# Altium project AC Voltage Controller.PrjPcb
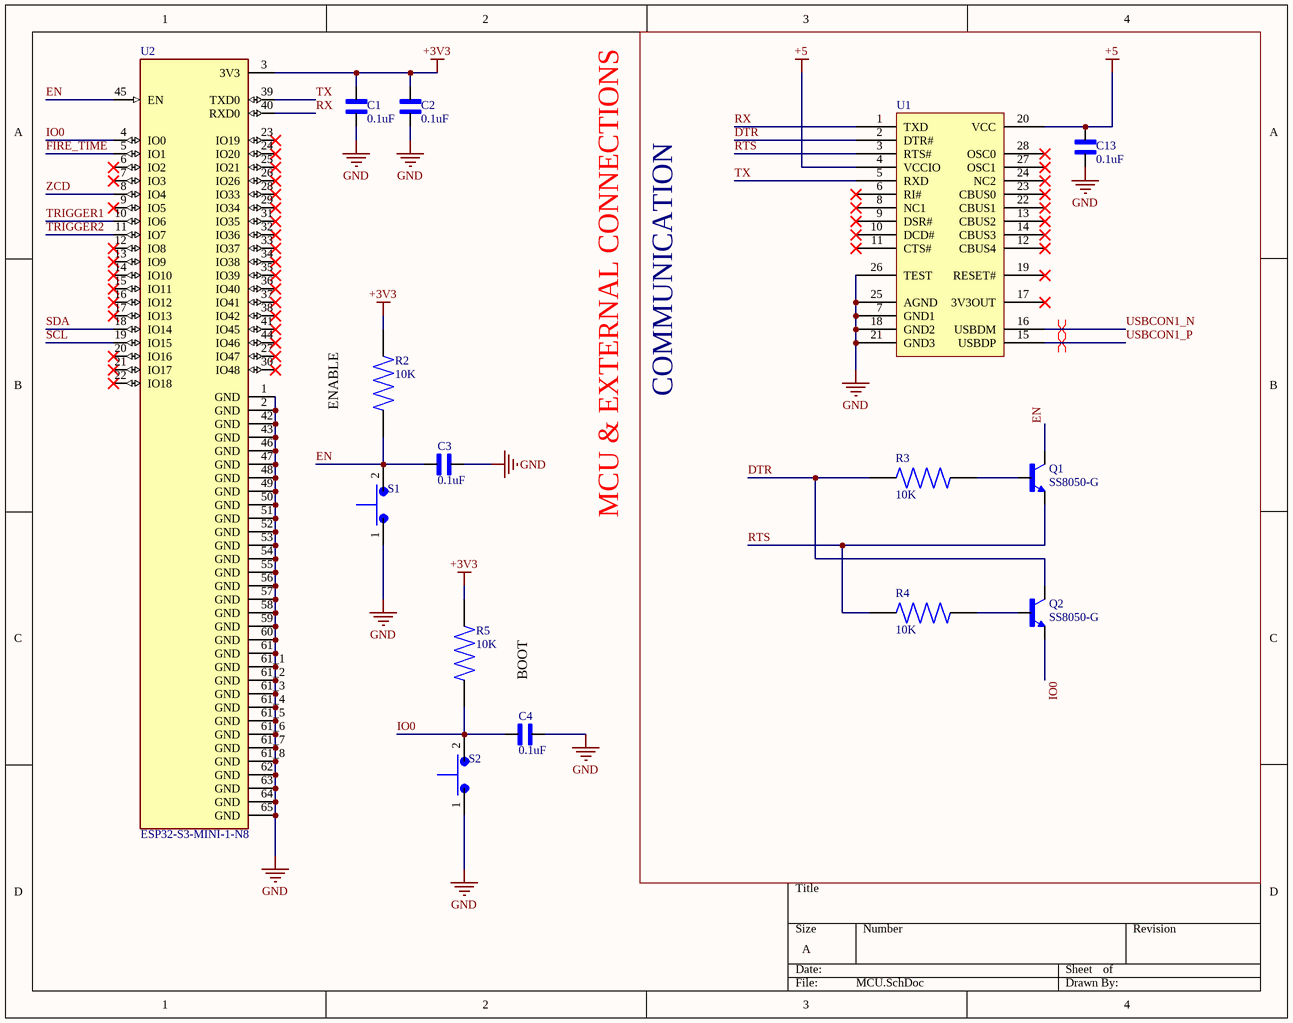
[diagram p0: MCU.SchDoc]
3 sheets, 50 parts. Net scope: global (net labels, ports and power ports of the same name join across sheets).
Board file: AC Voltage Controller.PcbDoc
Sheets:
  MCU.SchDoc
  USB & Power.SchDoc
  Triac Drive.SchDoc

## Sheet MCU.SchDoc
size A; SheetNumber: 1; SheetTotal: 3

### Parts
C1  0.1uF  [CAPC1005X61N]
C2  0.1uF  [CAPC1005X61N]
C3  0.1uF  [CAPC1005X61N]
C4  0.1uF  [CAPC1005X61N]
C13  0.1uF  [CAPC1005X61N]
Q1  SS8050-G  [TRANS_SS8050-G]
Q2  SS8050-G  [TRANS_SS8050-G]
R2  10K  [RESC1005X35N]
R3  10K  [RESC1005X35N]
R4  10K  [RESC1005X35N]
R5  10K  [RESC1005X35N]
S1  TS10-63-26-BE-250-SMT-TR  [SW_TS10-63-26-BE-250-SMT-TR]  (value not drawn)
S2  TS10-63-26-BE-250-SMT-TR  [SW_TS10-63-26-BE-250-SMT-TR]  (value not drawn)
U1  FT232RL, Universal Asynchronous Receiver & Transmitter 3MBd, 28-Pin, SSOP  [SOP65P780X200-28N]  (value not drawn)
U2  ESP32-S3-MINI-1-N8  [XCVR_ESP32-S3-MINI-1-N8]

### Blocks framed on the sheet
COMMUNICATION: C13 Q1 Q2 R3 R4 U1

### Nets
+3V3: C1.2 C2.2 R2.2 R5.2 U2.3(3V3)
+5: C13.2 U1.4(VCCIO) U1.20(VCC)
GND: C1.1 C2.1 C3.2 C4.2 C13.1 S1.1 S2.1 U1.7(GND1) U1.18(GND2) U1.21(GND3) U1.25(AGND) U1.26(TEST) U2.1(GND) U2.2(GND) U2.42(GND) U2.43(GND) U2.46(GND) U2.47(GND) U2.48(GND) U2.49(GND) U2.50(GND) U2.51(GND) U2.52(GND) U2.53(GND) U2.54(GND) U2.55(GND) U2.56(GND) U2.57(GND) U2.58(GND) U2.59(GND) U2.60(GND) U2.61(GND) U2.61_1(GND) U2.61_2(GND) U2.61_3(GND) U2.61_4(GND) U2.61_5(GND) U2.61_6(GND) U2.61_7(GND) U2.61_8(GND) U2.62(GND) U2.63(GND) U2.64(GND) U2.65(GND)
DTR: Q2.3(C) R3.1 U1.2(DTR#)
EN: C3.1 Q1.3(C) R2.1 S1.2 U2.45(EN)
FIRE_TIME: U2.5(IO1)
IO0: C4.1 Q2.2(E) R5.1 S2.2 U2.4(IO0)
RTS: Q1.2(E) R4.1 U1.3(RTS#)
RX: U1.1(TXD) U2.40(RXD0)
SCL: U2.19(IO15)
SDA: U2.18(IO14)
TRIGGER1: U2.10(IO6)
TRIGGER2: U2.11(IO7)
TX: U1.5(RXD) U2.39(TXD0)
USBCON1_N: U1.16(USBDM)
USBCON1_P: U1.15(USBDP)
ZCD: U2.8(IO4)
NetQ1_1: Q1.1(B) R3.2
NetQ2_1: Q2.1(B) R4.2

Not connected (* = marked no-connect by the designer): U1 6(RI#)* 8(NC1)* 9(DSR#)* 10(DCD#)* 11(CTS#)* 12(CBUS4)* 13(CBUS2)* 14(CBUS3)* 17(3V3OUT)* 19(RESET#)* 22(CBUS1)* 23(CBUS0)* 24(NC2)* 27(OSC1)* 28(OSC0)*; U2 6(IO2)* 7(IO3)* 9(IO5)* 12(IO8)* 13(IO9)* 14(IO10)* 15(IO11)* 16(IO12)* 17(IO13)* 20(IO16)* 21(IO17)* 22(IO18)* 23(IO19)* 24(IO20)* 25(IO21)* 26(IO26)* 27(IO47)* 28(IO33)* 29(IO34)* 30(IO48)* 31(IO35)* 32(IO36)* 33(IO37)* 34(IO38)* 35(IO39)* 36(IO40)* 37(IO41)* 38(IO42)* 41(IO45)* 44(IO46)*

### Layout directives
differential pair: USBCON1_N, USBCON1_P

### Notes on the sheet
- (near R2) ENABLE
- MCU & EXTERNAL CONNECTIONS
- BOOT

### Library data of the parts
C1-C4 C13 = VJ0402D130GXCAP: CAP CER 13PF 200V C0G/NP0 0402; MF: Vishay Vitramon; SnapEDA_Link: https://www.snapeda.com/parts/VJ0402D130GXCAP/Vishay/view-part/?ref=snap; Package: 1005 Vishay Vitramon; Value: *; MP: VJ0402D130GXCAP; Check_prices: https://www.snapeda.com/parts/VJ0402D130GXCAP/Vishay/view-part/?ref=eda
Q1 Q2 = SS8050-G: Bipolar (BJT) Transistor NPN 25 V 1.5 A 100MHz 300 mW Surface Mount SOT-23-3; MP: SS8050G; MF: Comchip; Digi-Key_Part_Number: 641-1790-2-ND; Check_prices: https://www.snapeda.com/parts/SS8050G/Comchip/view-part/?ref=eda; Package: None; SnapEDA_Link: https://www.snapeda.com/parts/SS8050G/Comchip/view-part/?ref=snap; Value: *
R2-R5 = RT0402FRE075K1L: Res Thin Film 0402 10K Ohm 1% 0.063W(1/16W) Â±50ppm/C Molded SMD Paper T/R; MF: Yageo; SnapEDA_Link: https://www.snapeda.com/parts/RT0402FRE075K1L/Yageo/view-part/?ref=snap; Package: 1005 Yageo; Value: *; MP: RT0402FRE075K1L; Check_prices: https://www.snapeda.com/parts/RT0402FRE075K1L/Yageo/view-part/?ref=eda
S1 S2 = TS10-63-26-BE-250-SMT-TR: 6.1 x 3.8 mm, 2.6 mm Actuator Height, 250 gf, Surface Mount, SPST, Tactile Switch; MF: Same Sky; SnapEDA_Link: https://www.snapeda.com/parts/TS10-63-26-BE-250-SMT-TR/Same+Sky/view-part/?ref=snap; Package: None; Value: *; MP: TS10-63-26-BE-250-SMT-TR; Check_prices: https://www.snapeda.com/parts/TS10-63-26-BE-250-SMT-TR/Same+Sky/view-part/?ref=eda
U1 = FT232RL USB to UART, Universal Asynchronous Receiver & Transmitter 3MBd, 28-Pin, SSOP: Manufacturer: FTDI Chip; Creator: R Kanjee; Date Created: 03 March 2015; Manufacturer Part No.: FT232RL; RS Stock No.: 406-580; Pin Count: 28
U2 = ESP32-S3-MINI-1-N8: MF: {'manufacturer': u'Espressif Systems'}; Package: None; Price: None; Value: *; MP: ESP32-S3-MINI-1-N8; Availability: Unavailable

## Sheet USB & Power.SchDoc
size A; SheetNumber: 2; SheetTotal: 3
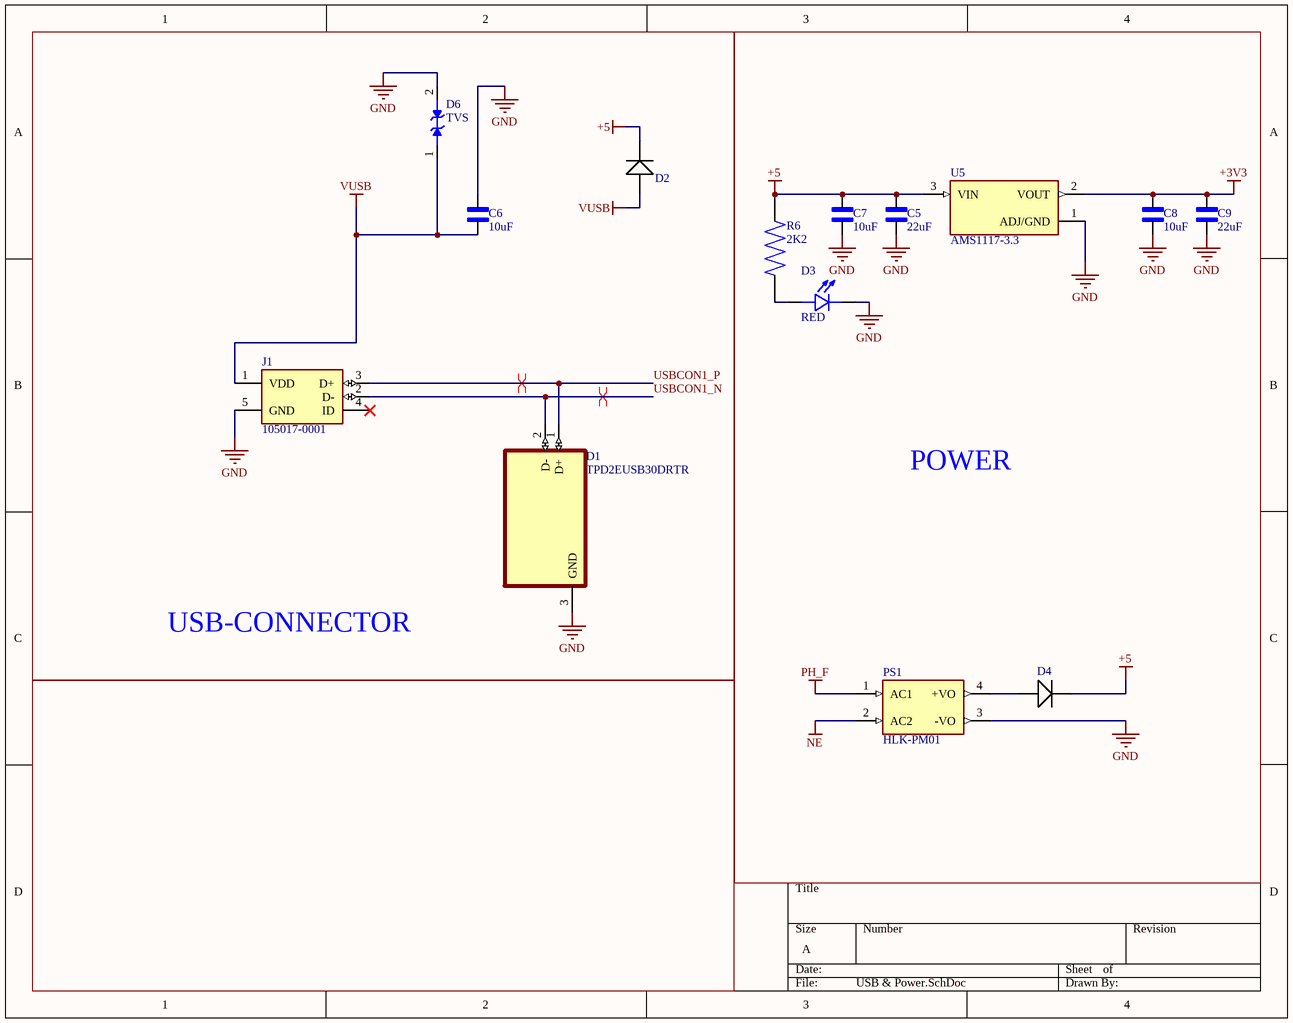
[diagram p1: USB & Power.SchDoc]

### Parts
C5  22uF  [CAPC1608X90]
C6  10uF  [CAPC1608X100N]
C7  10uF  [CAPC1608X100N]
C8  10uF  [CAPC1608X100N]
C9  22uF  [CAPC1608X90]
D1  TPD2EUSB30DRTR  [SOTFL35P100X50-3N]
D2  Panasonic DB2J20900L Schottky Diode, 0.5A, 20V, 2.4ns, 2-Pin SMini2 F5 B  [DIOM1712X07N]  (value not drawn)
D3  RED  [LED_APHHS1005LSECK/J3-PF]
D4  Panasonic DB2J20900L Schottky Diode, 0.5A, 20V, 2.4ns, 2-Pin SMini2 F5 B  [DIOM1712X07N]  (value not drawn)
D6  TVS  [DIO_TPD1E05U06DPYR]
J1  105017-0001  [MOLEX_105017-0001]
PS1  HLK-PM01  [CONV_HLK-PM01]
R6  2K2  [RESC1005X35N]
U5  AMS1117-3.3  [SOT229P700X180-4N]

### Blocks framed on the sheet
USB-CONNECTOR: C6 D1 D2 D6 J1
POWER: C5 C7-C9 D3 D4 PS1 R6 U5

### Nets
+3V3: C8.2 C9.1 U5.2(VOUT)
+5: C5.1 C7.2 D2.1 D4.1 R6.2 U5.3(VIN)
GND: C5.2 C6.2 C7.1 C8.1 C9.2 D1.3(GND) D3.1(C) D6.2(A1) J1.5(GND) PS1.3(-VO) U5.1(ADJ/GND)
NE: PS1.2(AC2)
PH_F: PS1.1(AC1)
VUSB: C6.1 D2.2 D6.1(A) J1.1(VDD)
USBCON1_N: D1.2(D-) J1.2(D-)
USBCON1_P: D1.1(D+) J1.3(D+)
NetD3_2: D3.2(A) R6.1
NetD4_2: D4.2 PS1.4(+VO)

Not connected (* = marked no-connect by the designer): J1 4(ID)*

### Layout directives
differential pair; differential pair class DIFF90: USBCON1_N, USBCON1_P

### Library data of the parts
C5 C9 = CC0603MRX5R6BB226: 22 ÂµF Â±20% 10V Ceramic Capacitor X5R 0603 (1608 Metric); MF: Yageo; SnapEDA_Link: https://www.snapeda.com/parts/CC0603MRX5R6BB226/Yageo/view-part/?ref=snap; Package: 0603 Yageo; Value: *; MP: CC0603MRX5R6BB226; Check_prices: https://www.snapeda.com/parts/CC0603MRX5R6BB226/Yageo/view-part/?ref=eda
C6-C8 = C1608X5R1E106M080AC: 10 ÂµF Â±20% 25V Ceramic Capacitor X5R 0603 (1608 Metric); MF: TDK Corporation; SnapEDA_Link: https://www.snapeda.com/parts/C1608X5R1E106M080AC/TDK/view-part/?ref=snap; Package: 1608-2 TDK; Value: *; MP: C1608X5R1E106M080AC; Check_prices: https://www.snapeda.com/parts/C1608X5R1E106M080AC/TDK/view-part/?ref=eda
D1 = TPD2EUSB30DRTR: 2-channel ESD solution for SuperSpeed USB 3.0 interface 3-SOT-9X3 -40 to 85; MF: Texas Instruments; Package: SOT-9X3-3 Texas Instruments; Purchase-URL: https://pricing.snapeda.com/search/part/TPD2EUSB30DRTR/?ref=eda; Value: *; MP: TPD2EUSB30DRTR; Availability: Warning; SnapEDA_Link: https://www.snapeda.com/parts/TPD2EUSB30DRTR/Texas%20Instruments/view-part/189118/?ref=snap; Price: None
D2 D4 = Schottky Diode, 0.5A, 20V, 2.4ns, 2-Pin SMini2 F5 B: Created By: R Kanjee; Date Created: 1 March 2015; Manufacturer: Panasonic; RS Stock No.: 713-2703; Manufacturer Part No.: DB2J20900L; Datasheet: http://docs-europe.electrocomponents.com/webdocs/1398/0900766b813986b3.pdf; Maximum Continuous Forward Current: 0.5A; Peak Reverse Repetitive Voltage: 20V
D3 = APHHS1005LSECK/J3-PF: Red 625nm LED Indication - Discrete 1.8V 0402 (1005 Metric); MF: Kingbright; SnapEDA_Link: https://www.snapeda.com/parts/APHHS1005LSECK/J3-PF/Kingbright/view-part/?ref=snap; Package: 0402 Kingbright Corporation; Value: *; MP: APHHS1005LSECK/J3-PF; Check_prices: https://www.snapeda.com/parts/APHHS1005LSECK/J3-PF/Kingbright/view-part/?ref=eda
D6 = TPD1E10B06DPYT: Single-channel ESD in 0402 package with 10pF capacitance and 6-V breakdown 2-X1SON -40 to 125; MF: Texas Instruments; Value: *; Package: X1SON-2 Texas Instruments; Purchase-URL: https://pricing.snapeda.com/search/part/TPD1E10B06DPYT/?ref=eda; SnapEDA_Link: https://www.snapeda.com/parts/TPD1E10B06DPYT/Texas%20Instruments/view-part/231963/?ref=snap; Digi-Key_Part_Number: 296-41842-1-ND; Check_prices: https://www.snapeda.com/parts/TPD1E10B06DPYT/Texas%20Instruments/view-part/231963/?ref=eda; MP: TPD1E10B06DPYT
J1 = 105017-0001: ÐŸÐ¾Ð´ÐºÐ».; Ð¿ÐµÑ€ÐµÐ´Ð°Ñ‡Ð° Ð´Ð°Ð½Ð½Ñ‹Ñ…; USB; Ð¿Ñ€Ð¸ÐµÐ¼; Micro; Ñ‚Ð¸Ð¿ B; Ð½Ð¸Ð¶Ð½ÐµÐµ ÐºÑ€ÐµÐ¿Ð»ÐµÐ½Ð¸Ðµ, SMT, Ñ Ð¿Ñ€Ð¸Ð¿Ð¾ÐµÐ¼, Ð±ÐµÐ· ÑÐ²Ð¸Ð½Ñ†Ð° ¦ Molex Incorporated 105017-0001; SnapEDA_Link: https://www.snapeda.com/parts/105017-0001/Molex/view-part/?ref=snap; Package: None; Value: *; MF: Molex; MP: 105017-0001; Check_prices: https://www.snapeda.com/parts/105017-0001/Molex/view-part/?ref=eda
PS1 = HLK-PM01: The HLK-PM01 is a small size low cost AC to DC converter which can take in 110V/220V AC at 50/60 Hz and give 5V 3W output. The module is can be used in designs which run on 5V and needs to be powered form the AC mains.; MF: Hi-link; SnapEDA_Link: https://www.snapeda.com/parts/hlk-pm01/Hi-link/view-part/?ref=snap; Package: None; Value: *; MP: hlk-pm01; Check_prices: https://www.snapeda.com/parts/hlk-pm01/Hi-link/view-part/?ref=eda
R6 = RT0402FRE075K1L: Res Thin Film 0402 2K2 Ohm 1% 0.063W(1/16W) Â±50ppm/C Molded SMD Paper T/R; MF: Yageo; SnapEDA_Link: https://www.snapeda.com/parts/RT0402FRE075K1L/Yageo/view-part/?ref=snap; Package: 1005 Yageo; Value: *; MP: RT0402FRE075K1L; Check_prices: https://www.snapeda.com/parts/RT0402FRE075K1L/Yageo/view-part/?ref=eda
U5 = AMS1117-3.3: Linear Voltage Regulator IC Positive Fixed 1 Output 1A SOT-223-3L; MF: UMW; SnapEDA_Link: https://www.snapeda.com/parts/AMS1117-3.3/UMW/view-part/?ref=snap; Package: SOT-223-3L UMW; Value: *; MP: AMS1117-3.3; Check_prices: https://www.snapeda.com/parts/AMS1117-3.3/UMW/view-part/?ref=eda

## Sheet Triac Drive.SchDoc
size A; SheetNumber: 3; SheetTotal: 3
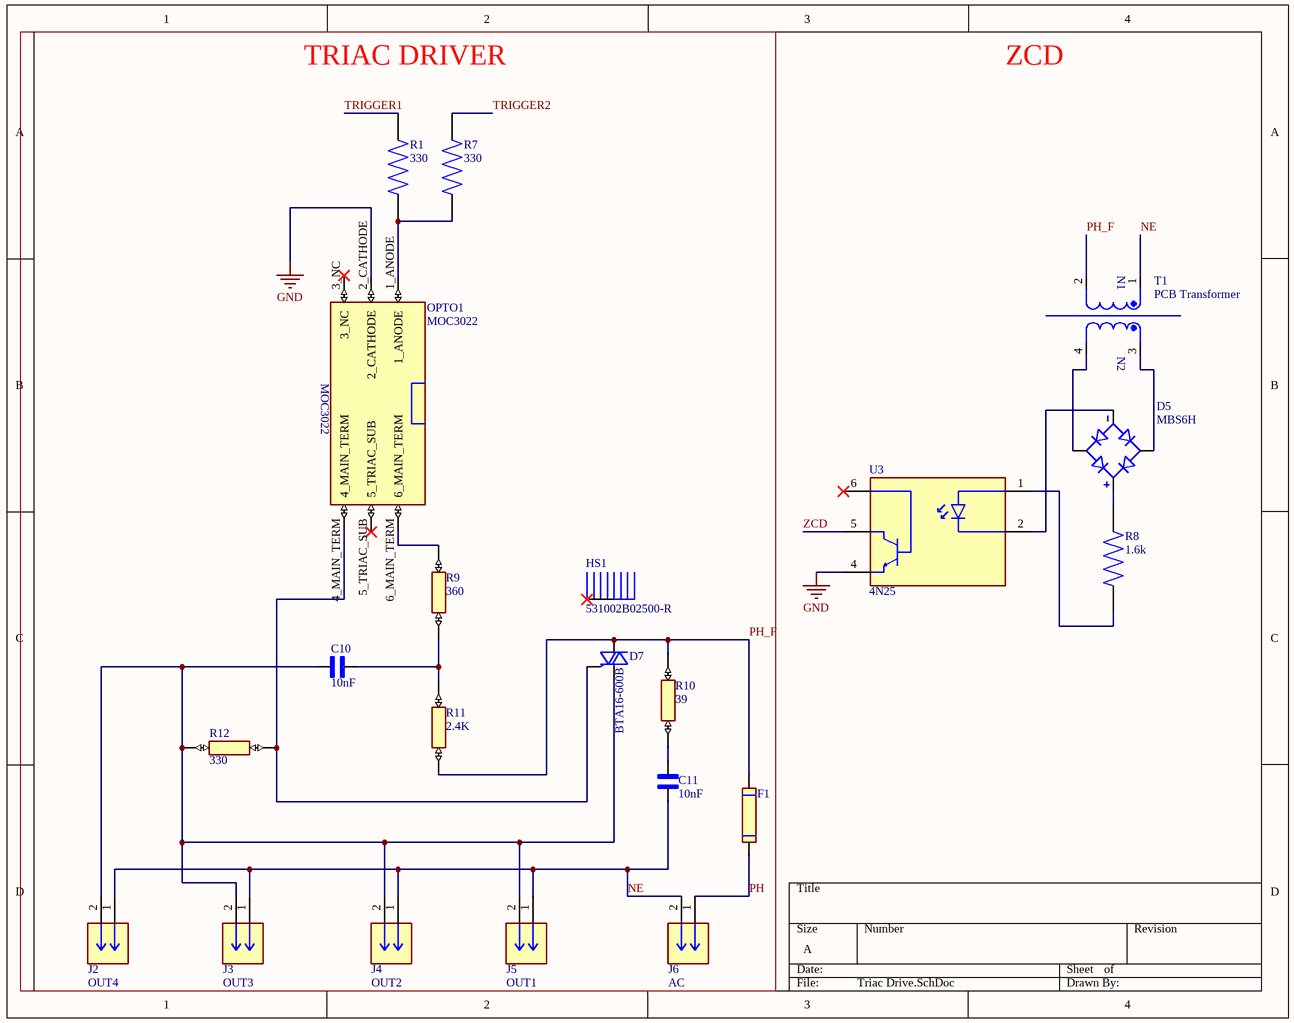
[diagram p2: Triac Drive.SchDoc]

### Parts
C10  10nF  [PCBComponent_1]
C11  10nF  [PCBComponent_1]
D5  MBS6H  [DIOB_MBS6H]
D7  BTA16-600B  [TO255P1040X460X1975-3]
F1  696101000002  [696101000002]  (value not drawn)
HS1  531002B02500-R  [HSINK_531002B02500-R]
J2  OUT4  [CONN_398800302_MOL]
J3  OUT3  [CONN_398800302_MOL]
J4  OUT2  [CONN_398800302_MOL]
J5  OUT1  [CONN_398800302_MOL]
J6  AC  [CONN_398800302_MOL]
OPTO1  MOC3022  [MOC3022]
R1  330  [RESAD700W45L350D185]
R7  330  [RESAD700W45L350D185]
R8  1.6k  [RESAD700W45L350D185]
R9  360  [RESAD2600W80L1000D400]
R10  39  [RESAD3850W80L1650D550]
R11  2.4K  [RESAD2600W80L1000D400]
R12  330  [RESAD2600W80L1000D400]
T1  PCB Transformer  [PCBComponent_1]
U3  4N25  [DIP762W50P254L712H400Q6N]

### Blocks framed on the sheet
TRIAC DRIVER: C10 C11 D7 F1 HS1 J2-J6 OPTO1 R1 R7 R9-R12

### Nets
GND: OPTO1.2_CATHODE U3.4(E)
NE: C11.2 J2.1 J3.1 J4.1 J5.1 J6.2 T1.1
PH_F: D7.2(A2) F1.2 R10.2 R11.1 T1.2
PH: F1.1 J6.1
TRIGGER1: R1.2
TRIGGER2: R7.2
ZCD: U3.5(C)
NetC10_1: C10.1 R9.1 R11.2
NetC10_2: C10.2 D7.1(A1) J2.2 J3.2 J4.2 J5.2 R12.2
NetC11_1: C11.1 R10.1
NetD5_AC1: D5.AC1 T1.4
NetD5_AC2: D5.AC2 T1.3
NetD5_NEG: D5.NEG U3.2(K)
NetD5_POS: D5.POS R8.2
NetD7_3: D7.3(G) OPTO1.4_MAIN_TERM R12.1
NetHS1_1: HS1.1(S) HS1.2(S)
NetOPTO1_1_ANODE: OPTO1.1_ANODE R1.1 R7.1
NetOPTO1_6_MAIN_TERM: OPTO1.6_MAIN_TERM R9.2
NetR8_1: R8.1 U3.1(A)

Not connected (* = marked no-connect by the designer): OPTO1 3_NC* 5_TRIAC_SUB*; U3 6(B)*

### Notes on the sheet
- ZCD
- (in symbol EI-30) N1; N2

### Library data of the parts
C10 C11 = Capacitor 10nF 630v
D5 = MBS6H: MF: {'manufacturer': u'Taiwan Semiconductor Corporation'}; Package: None; Price: None; Value: *; MP: MBS6H; Availability: Unavailable
D7 = BTA16-600B: TRIAC Alternistor - Snubberless 600 V 16 A Through Hole TO-220; MF: STMicroelectronics; SnapEDA_Link: https://www.snapeda.com/parts/BTA16-600B/STMicroelectronics/view-part/?ref=snap; Package: TO-220-3 STMicroelectronics; Value: *; MP: BTA16-600B; Check_prices: https://www.snapeda.com/parts/BTA16-600B/STMicroelectronics/view-part/?ref=eda
F1 = 696101000002: MF: {'manufacturer': u'W\xfcrth Elektronik'}; Package: None; Price: None; Value: *; MP: 696101000002; Availability: Unavailable
HS1 = 531002B02500-R: Heatsink To-220 2 Holes 2 Pins 1.38 X0.50 X1.00; MF: Jameco Valuepro; SnapEDA_Link: https://www.snapeda.com/parts/531002B02500-R/Jameco+Benchpro/view-part/?ref=snap; Package: Heatsink Jameco Valuepro; Value: *; MP: 531002B02500-R; Check_prices: https://www.snapeda.com/parts/531002B02500-R/Jameco+Benchpro/view-part/?ref=eda
J2-J6 = 398800302: 2 Position Wire to Board Terminal Block Horizontal with Board 0.200 (5.08mm) Through Hole; MF: Molex; MP: 0398800302; SnapEDA_Link: https://www.snapeda.com/parts/0398800302/Molex/view-part/?ref=snap; Package: None; Value: *; Check_prices: https://www.snapeda.com/parts/0398800302/Molex/view-part/?ref=eda
OPTO1 = MOC3022: Optoisolator Triac Output 5000Vrms 1 Channel 6-DIP; MF: Isocom Components; SnapEDA_Link: https://www.snapeda.com/parts/MOC3022/Isocom/view-part/?ref=snap; Package: DIP-6 Isocom Components; Value: *; MP: MOC3022; Check_prices: https://www.snapeda.com/parts/MOC3022/Isocom/view-part/?ref=eda
R1 R7 R8 = 2-1623927-3: Carbon Film Resistors - Through Hole 1K Ohm 5% 1/4W Res Carbon Film; Power_Rating: .25 W; MF: TE Connectivity; Voltage_Rating: 200 V; SnapEDA_Link: https://www.snapeda.com/parts/2-1623927-3/TE+Connectivity/view-part/?ref=snap; Package: None; Resistance: 1K; Value: *; MP: 2-1623927-3; EU_RoHS_Compliance: Compliant; Tolerance: 5%; Check_prices: https://www.snapeda.com/parts/2-1623927-3/TE+Connectivity/view-part/?ref=eda
R9 R12 = EMC2-47RKI: RES 360 OHM 2W 10% AXIAL; MF: TT Electronics/Welwyn; SnapEDA_Link: https://www.snapeda.com/parts/EMC2-47RKI/TT+Electronics%252FWelwyn/view-part/?ref=snap; Package: None; Value: *; MP: EMC2-47RKI; Check_prices: https://www.snapeda.com/parts/EMC2-47RKI/TT+Electronics%252FWelwyn/view-part/?ref=eda
R10 = PCF1C3R3K: 3.3 Ohms Â±10% 1W Through Hole Resistor Axial Automotive AEC-Q200, Flame Proof, Safety, Non-Inductive, Pulse Withstanding Ceramic; MF: KOA Speer; SnapEDA_Link: https://www.snapeda.com/parts/PCF1C3R3K/KOA+Speer/view-part/?ref=snap; Package: None; Value: *; MP: PCF1C3R3K; Check_prices: https://www.snapeda.com/parts/PCF1C3R3K/KOA+Speer/view-part/?ref=eda
R11 = EMC2-47RKI: RES 2.4K OHM 2W 10% AXIAL; MF: TT Electronics/Welwyn; SnapEDA_Link: https://www.snapeda.com/parts/EMC2-47RKI/TT+Electronics%252FWelwyn/view-part/?ref=snap; Package: None; Value: *; MP: EMC2-47RKI; Check_prices: https://www.snapeda.com/parts/EMC2-47RKI/TT+Electronics%252FWelwyn/view-part/?ref=eda
T1 = EI-30
U3 = 4N25: Optoisolator, Analog, 6-Pin DIP, Transistor, w/Base Connection | Vishay / Small Signal & Opto Products (SSP) 4N25; MF: Vishay Semiconductor; SnapEDA_Link: https://www.snapeda.com/parts/4N25/Vishay/view-part/?ref=snap; Package: DIP-6 Everlight Electronics CO., LTD; Value: *; MP: 4N25; Check_prices: https://www.snapeda.com/parts/4N25/Vishay/view-part/?ref=eda

## Nets that join several sheets
+3V3: MCU (5 pins), USB & Power (C8.2 C9.1 U5.2)
+5: MCU (C13.2 U1.4 U1.20), USB & Power (6 pins)
GND: MCU (44 pins), USB & Power (11 pins), Triac Drive (OPTO1.2_CATHODE U3.4)
NE: USB & Power (PS1.2), Triac Drive (7 pins)
PH_F: USB & Power (PS1.1), Triac Drive (5 pins)
TRIGGER1: MCU (U2.10), Triac Drive (R1.2)
TRIGGER2: MCU (U2.11), Triac Drive (R7.2)
USBCON1_N: MCU (U1.16), USB & Power (D1.2 J1.2)
USBCON1_P: MCU (U1.15), USB & Power (D1.1 J1.3)
ZCD: MCU (U2.8), Triac Drive (U3.5)

## Assembly variants
prototype: all parts fitted
Variant of NANOBOARD: all parts fitted